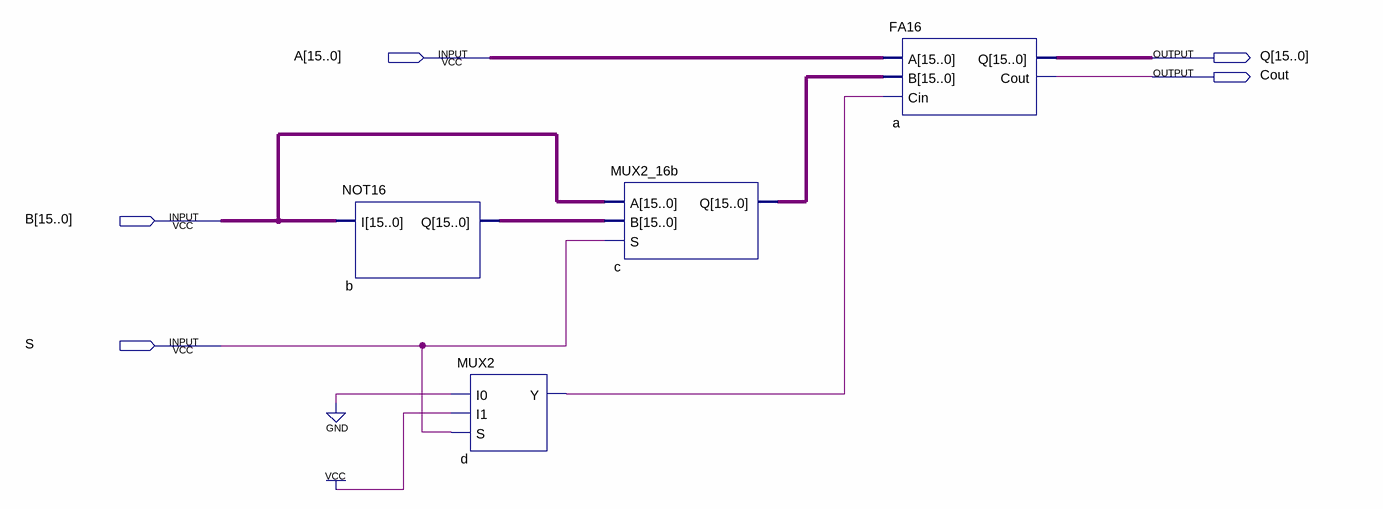
[diagram p0: schematic sheet]
// Quartus schematic HAS_16b.bdf as structural Verilog: 4 symbols, 5 pins
module HAS_16b (
  input  [15:0] A,
  input  [15:0] B,
  input  S,
  output [15:0] Q,
  output Cout
);

  wire d_y;
  wire [15:0] b_q, c_q;

  NOT16 u_b (.I(B), .Q(b_q));
  MUX2 d (.I0(1'b0), .I1(1'b1), .S(S), .Y(d_y));
  MUX2_16b c (.A(B), .B(b_q), .S(S), .Q(c_q));
  FA16 u_a (.A(A), .B(c_q), .Cin(d_y), .Q(Q), .Cout(Cout));
endmodule
